# EasyEDA Pro project AstraPulse.epro

# Schematic 智能手环电路原理图
Board Name: 智能手环; Create Date: 2025-06-26; Page Name: 智能手环电路原理图P1; Project Name: 智能手环设计; Schematic Name: 智能手环电路原理图; Update Date: 2025-06-30; Company: 嘉立创EDA; Page Size: A3; Version: V1.0
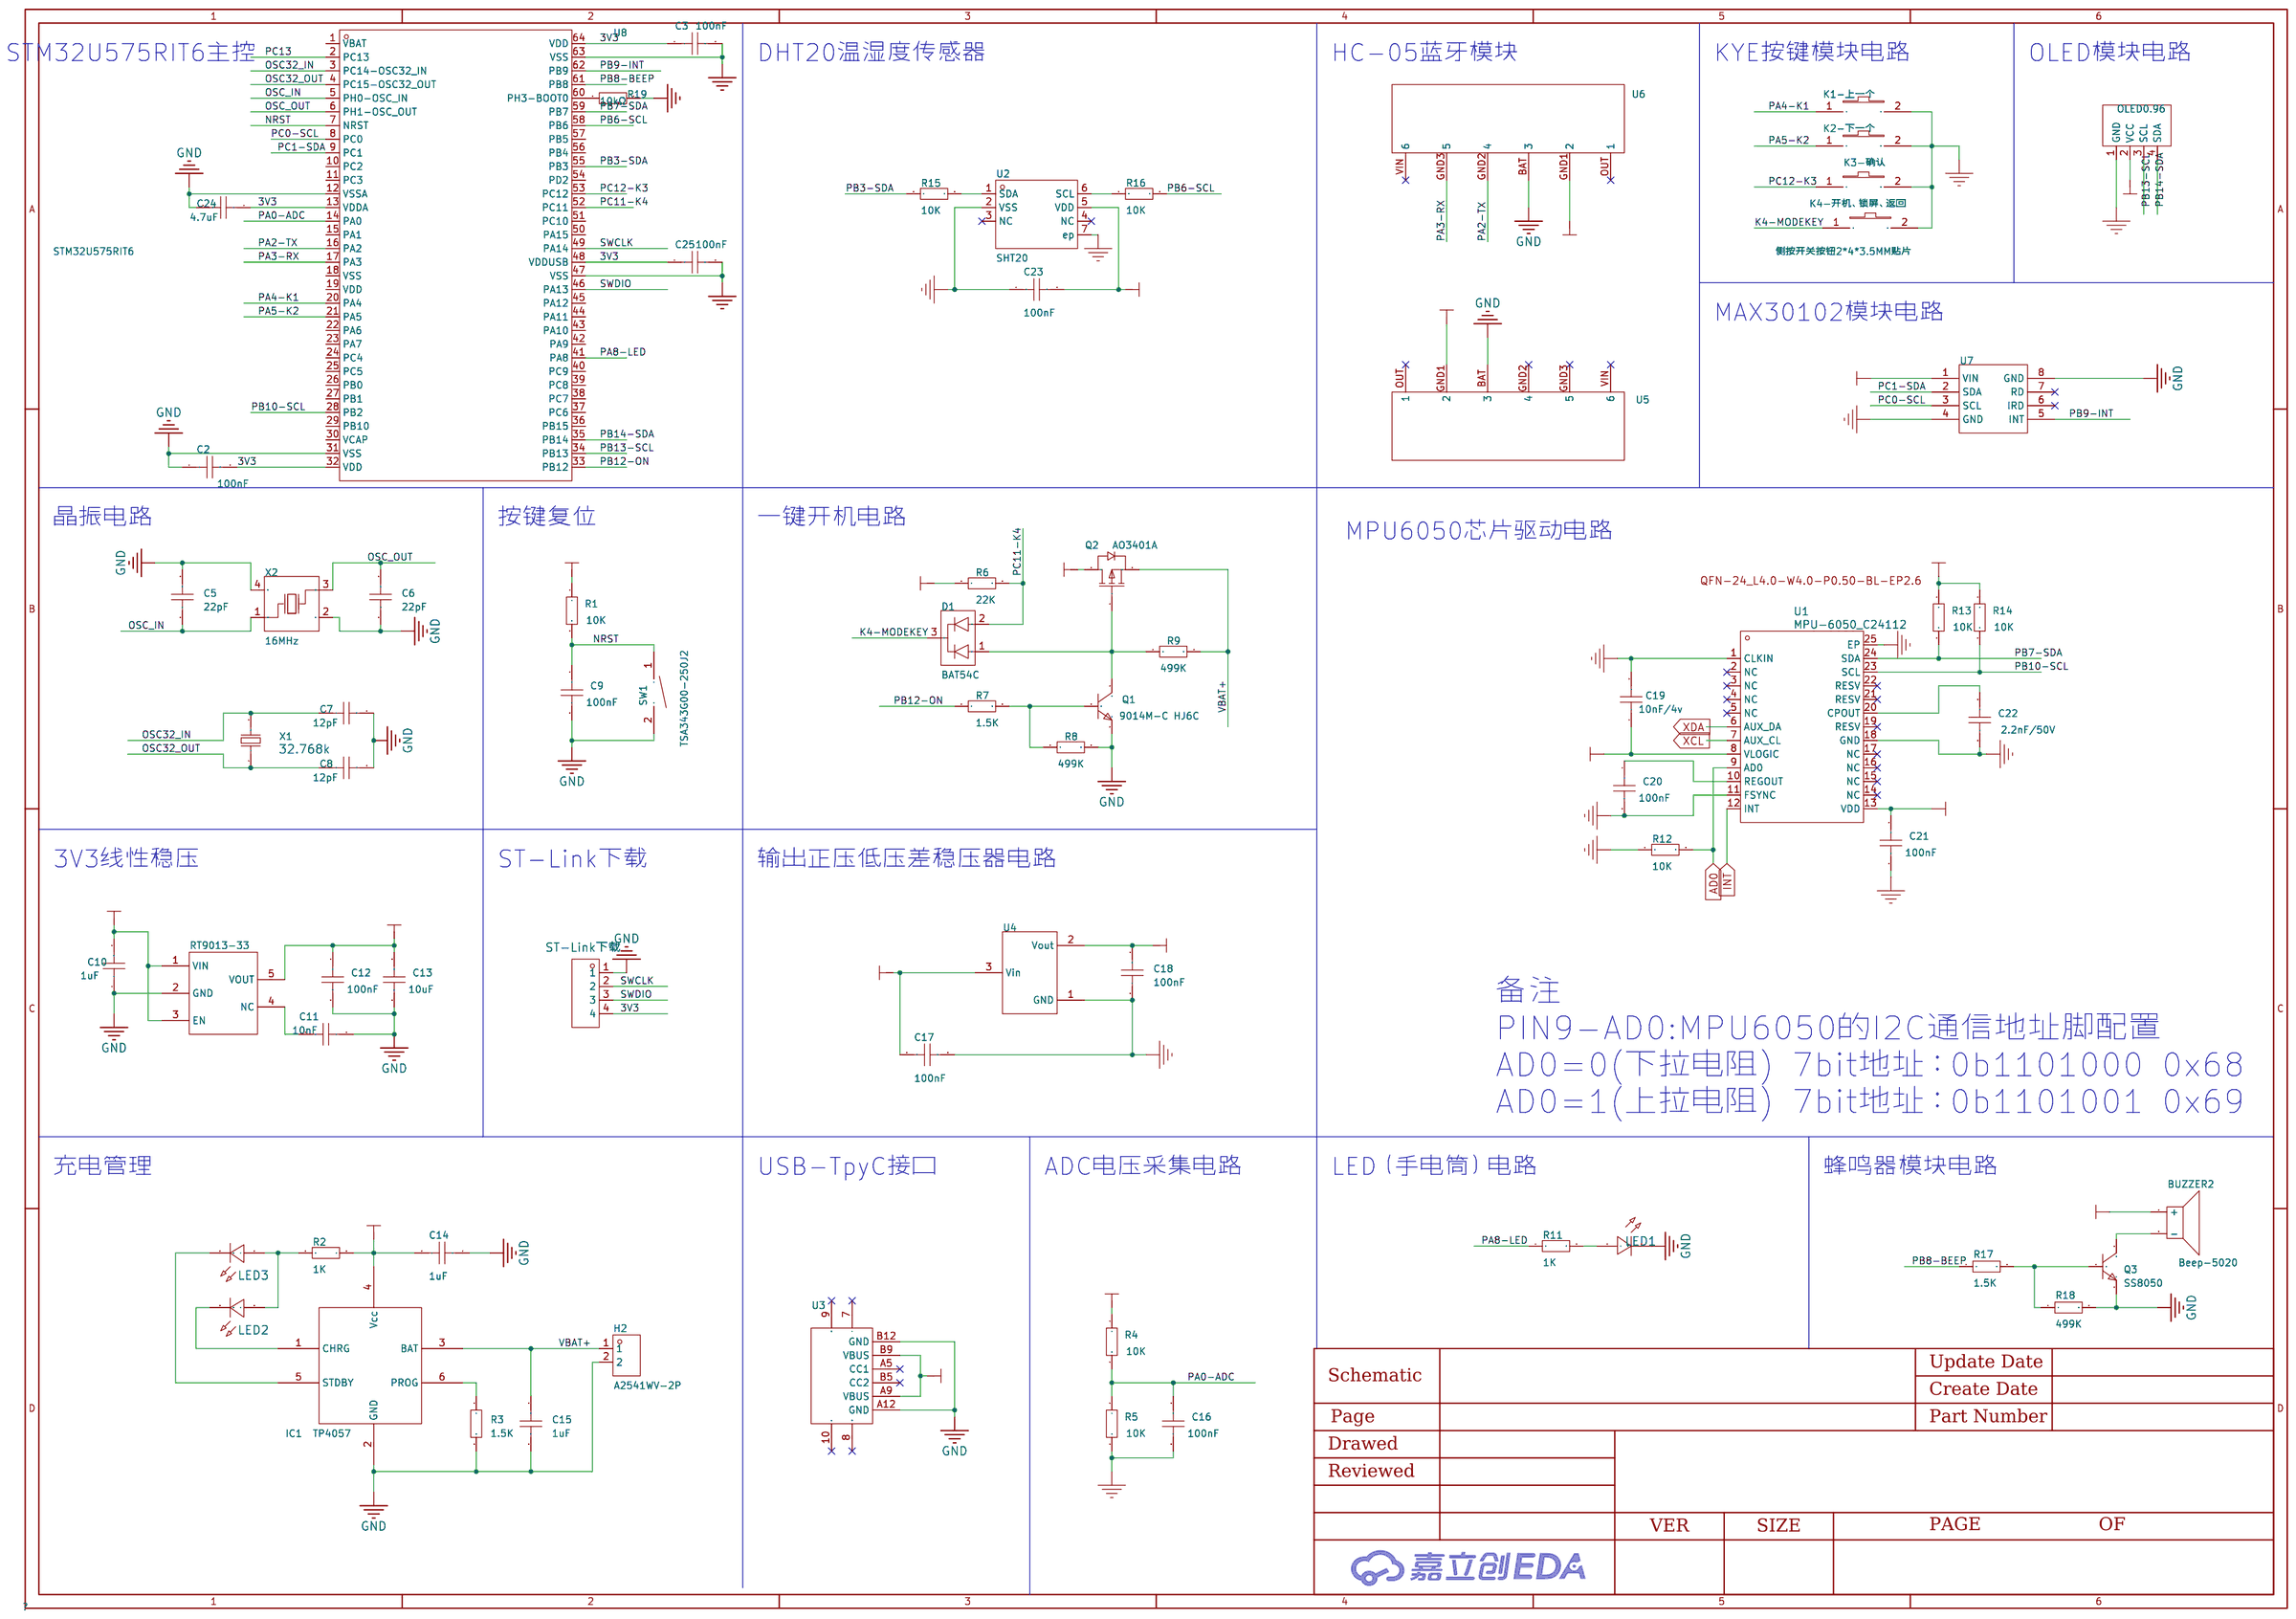
[diagram p0: schematic sheet]

## Parts
BUZZER2  Beep-5020  [5020BUZZER]
C2  100nF  [C0805]
C3  100nF  [C0805]
C5  22pF  [C0805]
C6  22pF  [C0805]
C7  12pF  [C0603]
C8  12pF  [C0603]
C9  100nF  [C0805]
C10  1uF  [C0603]
C11  10nF  [C0603]
C12  100nF  [C0805]
C13  10uF  [C0805]
C14  1uF  [C0603]
C15  1uF  [C0603]
C16  100nF  [C0805]
C17  100nF  [C0805]
C18  100nF  [C0805]
C19  100nF  [C0603]
C20  100nF  [C0805]
C21  100nF  [C0805]
C22  2.2nF/50V  [C0805]
C23  100nF  [C0805]
C24  4.7uF  [C0603]
C25  100nF  [C0805]
D1  BAT54C  [SOT-23-3_L2.9-W1.3-P1.90-LS2.4-BL-2]
H2  A2541WV-2P  [HDR-TH_P2.54-H-M_A2541WV-2P]
IC1  TP4057  [SOT23-6N]
K1-上一个  侧按开关按钮2*4*3.5MM贴片  [侧按开关按钮2*4*3.5MM贴片]
K2-下一个  侧按开关按钮2*4*3.5MM贴片  [侧按开关按钮2*4*3.5MM贴片]
K3-确认  侧按开关按钮2*4*3.5MM贴片  [侧按开关按钮2*4*3.5MM贴片]
K4-开机、锁屏、返回  侧按开关按钮2*4*3.5MM贴片  [侧按开关按钮2*4*3.5MM贴片]
LED1  -  [LED0805-RD_RED]
LED2  -  [LED0805-RD_RED]
LED3  -  [LED0805-RD_RED]
P1  OLED0.96  [0.96OLED_4P]
Q1  9014M-C HJ6C  [SOT-23-3_L2.9-W1.5-P1.90-LS2.6-BR]
Q2  AO3401A  [SOT-23_L2.9-W1.3-P1.90-LS2.4-BR]
Q3  SS8050  [SOT-23-3_L2.9-W1.3-P1.90-LS2.4-BR]
R1  10K  [R0805]
R2  1K  [R0805]
R3  1.5K  [R0603]
R4  10K  [R0805]
R5  10K  [R0805]
R6  22K  [R0603]
R7  1.5K  [R0603]
R8  499K  [R0603]
R9  499K  [R0603]
R11  1K  [R0805]
R12  10K  [R0805]
R13  10K  [R0805]
R14  10K  [R0805]
R15  10K  [R0805]
R16  10K  [R0805]
R17  1.5K  [R0603]
R18  499K  [R0603]
R19  10kΩ  [R0603]
RT9013-33  RT9013-33GB  [SOT-23-5_L3.0-W1.7-P0.95-LS2.8-BR]
ST-Link下载  ST-Link下载  [HDR-TH_4P-P2.54-V-M]
SW1  TSA343G00-250J2  [SW-SMD_L4.0-W2.9-LS5.0]
U1  MPU-6050_C24112  [QFN-24_L4.0-W4.0-P0.50-BL-EP2.6]
U2  SHT20  [DFN-6_L3.0-W3.0-P0.95-TR-EP]
U3  -  [Type C_SMD_6P]
U4  XC6206P332MR  [SOT-23-3_L2.9-W1.6-P1.90-LS2.8-BR]
U5  -  [5v六引脚焊盘]
U6  -  [5v六引脚焊盘]
U7  -  [MAX30102模块]
U8  STM32U575RIT6  [LQFP-64_L10.0-W10.0-P0.50-LS12.0-BL]
X1  32.768k  [CRYSTAL-SMD_L2.0-W1.2]
X2  16MHz  [OSC-SMD_4P-L3.2-W2.5-BL]

## Library data of the parts
BUZZER2 = Beep-5020
C2 C3 C5 C6 C9 C12 C13 C16-C18 C20-C23 C25 = CAP_0805: Supplier Footprint: 0805
C7 C8 C10 C11 C14 C15 C19 C24 = CAP_0603: 容值:100nF;精度:±10%;额定电压:50V;温度系数:X7R;; Supplier Footprint: 0603
D1 = BAT54C: 二极管配置:1对共阴极;直流反向耐压(Vr):30V;平均整流电流(Io):200mA;正向压降(Vf):520mV@100mA;反向电流(Ir):500A@25V;; LCSC Part Name: 30V 200mA 520mV@100mA; Supplier Part: C2688222; Manufacturer: WPMtek(维攀微); Supplier Footprint: SOT-23; JLCPCB Part Class: 扩展库; Datasheet: https://atta.szlcsc.com/upload/public/pdf/source/20210413/C2688222_4BA00EF72D68F115087B0C3F388C7378.pdf; Supplier: LCSC; Diode Configuration: 1对共阴极; Reverse Voltage (Vr): 30V; Average Rectified Current (Io): 200mA; Forward Voltage (Vf@If): 520mV@100mA; Reverse Leakage Current (Ir): 500A@25V
H2 = 焊盘: Supplier: LCSC; Supplier Part: C225477; Manufacturer: CJT(Changjiang Connectors); JLCPCB Part Class: 扩展库
IC1 = TP4057/4059
K1-上一个 K2-下一个 K3-确认 K4-开机、锁屏、返回 = 侧按开关按钮2*4*3.5MM贴片: link: https://item.taobao.com/item.htm?id=609087411286; 3DModel: SW-SMD_L7.6-W3.5-H3.5-P4.2; Supplier: LCSC; _: 3
LED1-LED3 = LED_0805-R: Supplier Footprint: 0805
P1 = OLED0.96
Q1 = 9014M-C HJ6C: 晶体管类型:NPN;集射极击穿电压(Vceo):45V;集电极电流(Ic):100mA;功率(Pd):400mW;集电极截止电流(Icbo):50nA;集电极-发射极饱和电压(VCE(sat)@Ic,Ib):140mV@100mA,5mA;直流电流增益(hFE@Ic,Vce):200@1mA,5V;特征频率(fT):270MHz;工作温度:+150℃@(Tj);; Supplier Part: C2859128; Manufacturer: BLUE ROCKET(蓝箭); Supplier Footprint: SOT-23; JLCPCB Part Class: 扩展库; Datasheet: https://atta.szlcsc.com/upload/public/pdf/source/20210806/E21B7633B099C6836F6A2D156763F1FF.pdf; Supplier: LCSC; Transistor Type: NPN; Collector-Emitter Breakdown Voltage (Vceo): 45V; Collector Current (Ic): 100mA; Power Dissipation (Pd): 400mW; Collector Cut-Off Current (Icbo): 50nA; Collector-Emitter Saturation Voltage (VCE(sat)@Ic,Ib): 140mV@100mA,5mA; DC Current Gain (hFE@Ic,Vce): 200@1mA,5V; Transition Frequency (fT): 270MHz; Operating Temperature: +150℃@(Tj)
Q2 = AO3401A_C15127: 类型:P沟道;漏源电压(Vdss):30V;连续漏极电流(Id):4A;功率(Pd):1.4W;导通电阻(RDS(on)@Vgs,Id):44mΩ@10V,4.3A;阈值电压(Vgs(th)@Id):1.3V@250A;; LCSC Part Name: P沟道 30V 4A; Supplier Part: C15127; Manufacturer: AOS; Supplier Footprint: SOT-23-3L; JLCPCB Part Class: 基础库; Datasheet: https://atta.szlcsc.com/upload/public/pdf/source/20160507/1462613609053.pdf; Supplier: LCSC; Type: P沟道; Drain Source Voltage (Vdss): 30V; Continuous Drain Current (Id): 4A; Power Dissipation (Pd): 1.4W; Drain Source On Resistance (RDS(on)@Vgs,Id): 44mΩ@10V,4.3A; Gate Threshold Voltage (Vgs(th)@Id): 1.3V@250A
Q3 = SS8050: Supplier Part: C2984679; Manufacturer: 集晶电子; Supplier Footprint: SOT-23; Datasheet: https://atta.szlcsc.com/upload/public/pdf/source/20220324/C9C5DC8A4D94A268D9E3BE9A0C1D5819.pdf; Supplier: LCSC
R1 R2 R4 R5 R11-R16 = Res_0805: Supplier Footprint: 0805
R3 R6-R9 R17 R18 = Res_0603: Supplier Footprint: 0603
R19 = 0603WAF1002T5E: 电阻类型:厚膜电阻;阻值:10kΩ;精度:±1%;功率:100mW;最大工作电压:75V;温度系数:±100ppm/℃;; LCSC Part Name: 厚膜电阻 10kΩ ±1% 100mW; Supplier Part: C25804; Manufacturer: UNI-ROYAL(厚声); Supplier Footprint: 0603; JLCPCB Part Class: 基础库; Datasheet: https://atta.szlcsc.com/upload/public/pdf/source/20200306/C422600_1E6D84923E4A46A82E41ADD87F860B5C.pdf; Supplier: LCSC; Type: 厚膜电阻; Tolerance: ±1%; Power(Watts): 100mW; Overload Voltage (Max): 75V; Temperature Coefficient: ±100ppm/℃; Operating Temperature Range: -55℃~+155℃
RT9013-33 = RT9013-33GB: 输出类型:固定;输出极性:正;输出通道数:1;最大输入电压:5.5V;输出电压:3.3V;压差:400mV@(500mA);静态电流(地电流):-;输出电流:500mA;电源纹波抑制比(PRSS):50dB@(10kHz);噪声:-;特性:-;; LCSC Part Name: Vin=5.5V Vout=3.3V 500mA 50dB@(10kHz); Supplier Part: C47773; Manufacturer: RICHTEK(台湾立锜); Supplier Footprint: SOT-23-5; Datasheet: https://atta.szlcsc.com/upload/public/pdf/source/20150504/1457707282459.pdf; Supplier: LCSC; Output Type: 固定; Output Polarity: 正; Number of Outputs: 1; Maximum Input Voltage: 5.5V; Output Voltage: 3.3V; Dropout Voltage: 400mV@(500mA); Output Current: 500mA; Power Supply Rejection Ratio (PRSS): 50dB@(10kHz)
ST-Link下载 = HDR-M_2.54_1x4P: Supplier Part: C492403; Supplier Footprint: 插件
SW1 = TSA343G00-250J2: 触点电流:50mA;额定电压(DC):12V;绝缘电阻:100MΩ;电路结构:单刀单掷;安装方式:立贴;按钮形状:圆形按钮;按钮/盖帽颜色:黑色;带灯:无;作用力:250gf@±50gf;机械寿命:50000;工作温度:-25℃~+70℃;引脚样式:SMD接片;开关长度:3.95mm;开关宽度:2.9mm;开关高度:2mm;带支架:否;; LCSC Part Name: 3*4 两脚小龟不带柱  250gf; Supplier Part: C354946; Manufacturer: BRIGHT(博瑞泰); Supplier Footprint: SMD; JLCPCB Part Class: 扩展库; Datasheet: https://atta.szlcsc.com/upload/public/pdf/source/20190426/C354946_6B70DFBDFA823D17B8EB46FB9599F693.pdf; Supplier: LCSC; Contact Current: 50mA; Voltage Rating (DC): 12V; Insulation Resistance: 100MΩ; Circuit: 单刀单掷; Mounting Style: 立贴; Actuator Style: 圆形按钮; Actuator/Cap Color: 黑色; With Lamp: 无; Operating Force: 250gf@±50gf; Mechanical Life: 50000; Operating Temperature: -25℃~+70℃; Pin Style: SMD接片; Switch Length: 3.95mm; Switch Width: 2.9mm; Switch Height: 2mm; Strike Gundam: 否
U1 = MPU-6050_C24112: Supplier: LCSC; Manufacturer: InvenSense; Manufacturer Part: MPU-6050; image: //image.lceda.cn/szlcsc/C24112.jpg; Supplier Part: C24112; JLCPCB Part Class: Basic
U2 = SHT20: 传感器类型:Humidity, Temperature;输出类型:I²C;温度范围:-;湿度范围:0 ~ 100% RH;精度:±3% RH;; Supplier Part: C53865; Manufacturer: Sensirion(瑞士盛思锐); Supplier Footprint: DFN-6; JLCPCB Part Class: 扩展库; Datasheet: https://atta.szlcsc.com/upload/public/pdf/source/20151012/1457707445424.pdf; Supplier: LCSC; Sensor Type: Humidity, Temperature; Output Type: I²C; Humidity Range: 0 ~ 100% RH; Response Time: 8s; Accuracy: ±3% RH; Voltage-Supply: 2.1 V ~ 3.6 V; Operating Temperature: -40°C ~ 125°C
U3 = USB
U4 = XC6206P332MR_C5446: 输出类型:固定;输出极性:正;输出通道数:1;最大输入电压:6V;输出电压:3.3V;压差:680mV@(100mA);输出电流:200mA;电源纹波抑制比(PRSS):-;; LCSC Part Name: Vin=6V Vout=3.3V 200mA; Supplier Part: C5446; Manufacturer: TOREX(特瑞仕); Supplier Footprint: SOT-23-3L; JLCPCB Part Class: 基础库; Datasheet: https://atta.szlcsc.com/upload/public/pdf/source/20130801/1457706628791.pdf; Supplier: LCSC; Output Type: 固定; Output Polarity: 正; Number of Outputs: 1; Maximum Input Voltage: 6V; Output Voltage: 3.3V; Dropout Voltage: 680mV@(100mA); Output Current: 200mA
U5 U6 = 焊盘
U7 = MAX30102模块: Pin Type: IN
U8 = STM32U575RIT6: 超低功耗，采用带 Trust Zone 的 FPU Arm Cortex-M33、具有 1Mbytes 闪存的 160 MHz MCU; LCSC Part Name: 超低功耗带 FPU 的 Arm Cortex-M33 具有 Trust Zone，160 MHz MCU 带 2MB 闪存; Supplier Part: C5270993; Manufacturer: ST(意法半导体); Supplier Footprint: LQFP-64(10x10); JLCPCB Part Class: 扩展库; Supplier: LCSC
X1 = NX2012SA-32.768KHZ-EXS00A-MU00185: LCSC Part Name: 晶振; Supplier Part: C5136772; Manufacturer: NDK; Supplier Footprint: SMD2012-2P; Datasheet: https://atta.szlcsc.com/upload/public/pdf/source/20220817/FD1986C2337CA9746430CB47DBD29D81.pdf; Supplier: LCSC
X2 = X322516MLB4SI: 晶振类型:贴片晶振;频率:16MHz;常温频差:±10ppm;负载电容:9pF;频率稳定度:±20ppm;; LCSC Part Name: YSX321SL 16MHZ 4P 3225 9PF ±10PPM -40~85℃ (±20PPM); Supplier Part: C13738; Manufacturer: YXC(扬兴晶振); Supplier Footprint: SMD3225-4P; JLCPCB Part Class: 基础库; Datasheet: https://atta.szlcsc.com/upload/public/pdf/source/20240329/19D5F850207469550BEB00D7DFEDBC7A.pdf; Supplier: LCSC; Type: 贴片晶振; Normal temperature Frequency Tolerance: ±10ppm; Load Capacitance: 9pF; Frequency Stability: ±20ppm; Operating Temperature: -40℃~+85℃

## Nets
3V3: BUZZER2.1(+) C2.2 C3.1 C12.1 C13.1 C18.1 C19.1 C23.2 C24.1 C25.1 P1.2(VCC) R1.1 R13.1 R14.1 RT9013-33.5(VOUT) ST-Link下载.4 U1.8(VLOGIC) U2.5(VDD) U4.2(Vout) U5.GND1(2) U6.GND1(2) U7.1(VIN) U8.13(VDDA) U8.32(VDD) U8.48(VDDUSB) U8.64(VDD)
5V: C10.2 C14.2 IC1.4(Vcc) R2.2 RT9013-33.1(VIN) RT9013-33.3(EN) U3.A9(VBUS) U3.B9(VBUS)
+3V3: C21.1 U1.13(VDD)
GND: C2.1 C3.2 C5.1 C6.2 C7.2 C8.2 C9.2 C10.1 C11.2 C12.2 C13.2 C14.1 C15.2 C16.2 C17.2 C18.2 C19.2 C20.2 C21.2 C22.2 C23.1 C24.2 C25.2 H2.2 IC1.2(GND) K1-上一个.2 K2-下一个.2 K3-确认.2 K4-开机、锁屏、返回.2 LED1.1(C) P1.1(GND) Q1.2(E) Q3.2(E) R3.2 R5.2 R8.2 R12.1 R18.2 R19.1 RT9013-33.2(GND) ST-Link下载.1 SW1.2 U1.1(CLKIN) U1.11(FSYNC) U1.18(GND) U1.25(EP) U2.2(VSS) U2.7(ep) U3.A12(GND) U3.B12(GND) U4.1(GND) U5.BAT(3) U6.BAT(3) U7.4(GND) U7.8(GND) U8.12(VSSA) U8.31(VSS) U8.47(VSS) U8.63(VSS) X2.2(GND) X2.4(GND)
VBAT+: C15.1 H2.1 IC1.3(BAT) Q2.2(S) R9.2
AD0: R12.2 U1.9(AD0)
INT: U1.12(INT)
K4-MODEKEY: D1.3 K4-开机、锁屏、返回.1
NRST: C9.1 R1.2 SW1.1 U8.7(NRST)
OSC32_IN: C7.1 U8.3(PC14-OSC32_IN) X1.2
OSC32_OUT: C8.1 U8.4(PC15-OSC32_OUT) X1.1
OSC_IN: C5.2 U8.5(PH0-OSC_IN) X2.1(OSC1)
OSC_OUT: C6.1 U8.6(PH1-OSC_OUT) X2.3(OSC2)
PA0-ADC: C16.1 R4.2 R5.1 U8.14(PA0)
PA2-TX: U6.GND2(4) U8.16(PA2)
PA3-RX: U6.GND3(5) U8.17(PA3)
PA4-K1: K1-上一个.1 U8.20(PA4)
PA5-K2: K2-下一个.1 U8.21(PA5)
PA8-LED: R11.1 U8.41(PA8)
PB3-SDA: R15.1 U8.55(PB3)
PB6-SCL: R16.2 U8.58(PB6)
PB7-SDA: R13.2 U1.24(SDA) U8.59(PB7)
PB8-BEEP: R17.1 U8.61(PB8)
PB9-INT: U7.5(INT) U8.62(PB9)
PB10-SCL: R14.2 U1.23(SCL) U8.28(PB2)
PB12-ON: R7.1 U8.33(PB12)
PB13-SCL: P1.3(SCL) U8.34(PB13)
PB14-SDA: P1.4(SDA) U8.35(PB14)
PC0-SCL: U7.3(SCL) U8.8(PC0)
PC1-SDA: U7.2(SDA) U8.9(PC1)
PC11-K4: D1.2 R6.2 U8.52(PC11)
PC12-K3: K3-确认.1 U8.53(PC12)
PC13: U8.2(PC13)
SWCLK: ST-Link下载.2 U8.49(PA14)
SWDIO: ST-Link下载.3 U8.46(PA13)
VBIN: C17.1 Q2.3(D) R4.1 R6.1 U4.3(Vin)
XCL: U1.7(AUX_CL)
XDA: U1.6(AUX_DA)
$1N2261: C11.1 RT9013-33.4(NC)
$1N12198: C20.1 U1.10(REGOUT)
$1N12210: C22.1 U1.20(CPOUT)
$1N23815: LED1.2(A) R11.2
$1N30743: R15.2 U2.1(SDA)
$1N30780: R16.1 U2.6(SCL)
$1N48772: LED2.2(A) LED3.2(A) R2.1
$1N48899: IC1.1(CHRG) LED2.1(C)
$1N48944: IC1.5(STDBY) LED3.1(C)
$1N49675: IC1.6(PROG) R3.1
$1N61002: D1.1 Q1.3(C) Q2.1(G) R9.1
$1N62160: Q1.1(B) R7.2 R8.1
$1N117138: Q3.1(B) R17.2 R18.1
$1N117609: BUZZER2.2(-) Q3.3(C)
$1N136520: R19.2 U8.60(PH3-BOOT0)

Not connected (* = marked no-connect by the designer): U1 2(NC)* 3(NC)* 4(NC)* 5(NC)* 14(NC)* 15(NC)* 16(NC)* 17(NC)* 19(RESV)* 21(RESV)* 22(RESV)*; U2 3(NC)* 4(NC)*; U3 7* 8(10)* 9(8)* 10(9)* A5(CC1)* B5(CC2)*; U5 GND2(4)* GND3(5)* OUT(1)* VIN(6)*; U6 OUT(1)* VIN(6)*; U7 6(IRD)* 7(RD)*; U8 1(VBAT) 10(PC2) 11(PC3) 15(PA1) 18(VSS) 19(VDD) 22(PA6) 23(PA7) 24(PC4) 25(PC5) 26(PB0) 27(PB1) 29(PB10) 30(VCAP) 36(PB15) 37(PC6) 38(PC7) 39(PC8) 40(PC9) 42(PA9) 43(PA10) 44(PA11) 45(PA12) 50(PA15) 51(PC10) 54(PD2) 56(PB4) 57(PB5)

## Notes on the sheet
- STM32U575RIT6主控
- DHT20温湿度传感器
- HC-05蓝牙模块
- KYE按键模块电路
- OLED模块电路
- MAX30102模块电路
- 晶振电路
- 按键复位
- 一键开机电路
- MPU6050芯片驱动电路
- 3V3线性稳压
- ST-Link下载
- 输出正压低压差稳压器电路
- 备注
  PIN9-AD0:MPU6050的I2C通信地址脚配置
  AD0=0(下拉电阻) 7bit地址：0b1101000 0x68
  AD0=1(上拉电阻) 7bit地址：0b1101001 0x69
- 充电管理
- USB-TpyC接口
- ADC电压采集电路
- LED（手电筒）电路
- 蜂鸣器模块电路

# Board 智能手环PCB1
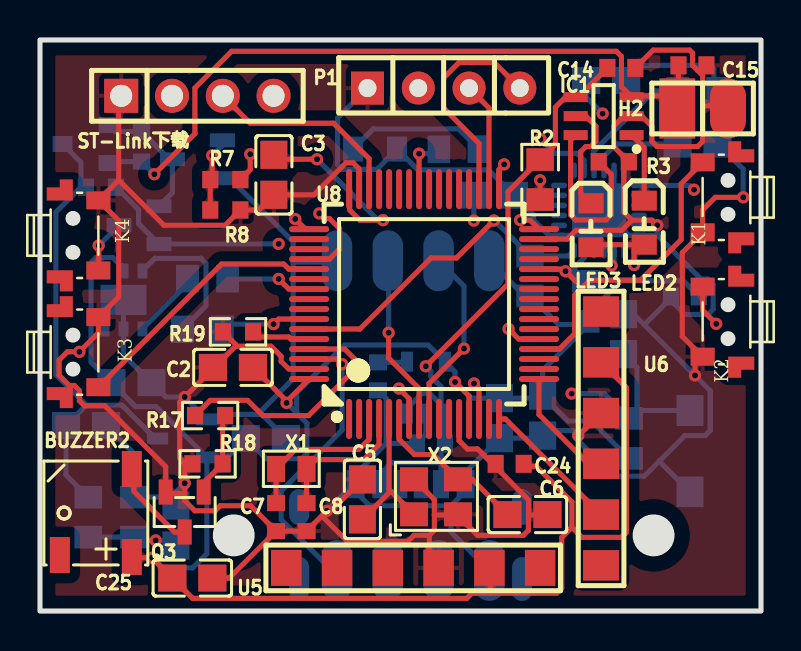
[diagram p1: board, top side]
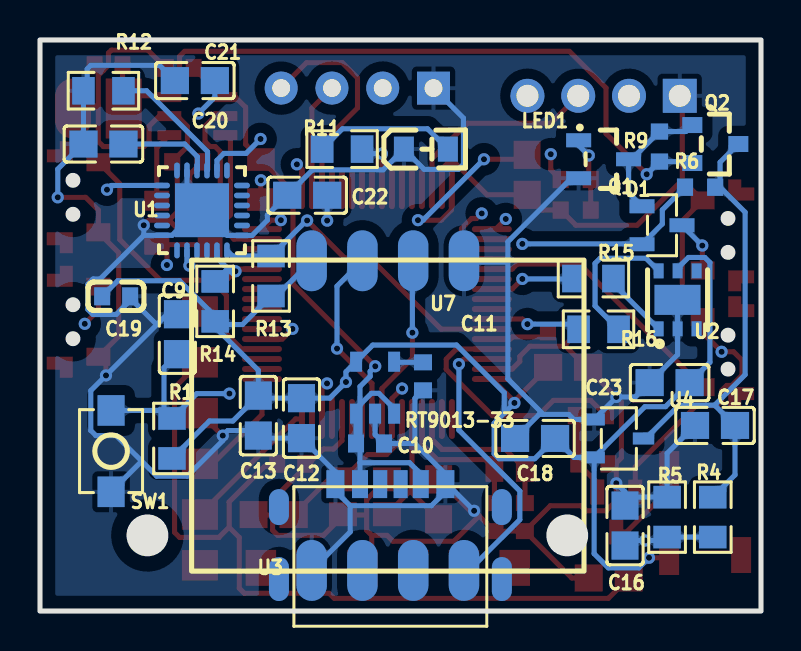
[diagram p2: board, bottom side, seen from below]

Outline 36.07 x 28.58 mm; copper layers: Top Layer, VCC, GND, Bottom Layer. Coordinates in mm from the lower left corner of the outline.
Outline path: rectangle 0,28.58 36.07,0
Stack: Top Layer 0.035mm / Dielectric1 0.48mm PP er 4.5 / VCC 0.035mm / Dielectric2 0.48mm FR4 er 4.5 / GND 0.035mm / Dielectric3 0.48mm PP er 4.5 / Bottom Layer 0.035mm

## Design rules (mm)
spacing safeClearance (default): track to track 0.152, other pairs 0.152 to 0.3
track width trackWidth (default): min 0.127, default 0.254, max 2.54
differential pair differentialPair (default): width min 0.127, default 0.254, max 2.54; gap min 0.152, default 0.152
via viaSize (default): diameter min 0.5, default 0.61, max 10; hole min 0.3, default 0.305, max 6
net GND uses copperRegion1

## Placement (name value [footprint] x y rotation side)
BUZZER2  Beep-5020  [5020BUZZER]  2.79 4.95 0 top
C2  100nF  [C0805]  9.65 12.19 0 top
C3  100nF  [C0805]  11.7 21.83 270 top
C5  22pF  [C0805]  16.13 5.59 270 top
C6  22pF  [C0805]  24.38 4.83 0 top
C7  12pF  [C0603]  11.81 4.7 270 top
C8  12pF  [C0603]  13.34 4.7 270 top
C9  100nF  [C0805]  29.19 13.85 90 bottom
C10  1uF  [C0603]  19.56 8.38 0 bottom
C11  10nF  [C0603]  16.91 11.74 270 bottom
C12  100nF  [C0805]  22.99 9.65 270 bottom
C13  10uF  [C0805]  25.15 9.78 270 bottom
C14  1uF  [C0603]  29.08 27.18 180 top
C15  1uF  [C0603]  32.64 27.3 0 top
C16  100nF  [C0805]  6.8 4.28 90 bottom
C17  100nF  [C0805]  2.3 9.29 0 bottom
C18  100nF  [C0805]  11.3 8.64 0 bottom
C19  100nF  [C0603]  32.26 15.75 180 bottom
C20  100nF  [C0805]  32.89 23.37 0 bottom
C21  100nF  [C0805]  28.32 26.54 0 bottom
C22  2.2nF/50V  [C0805]  22.7 20.81 0 bottom
C23  100nF  [C0805]  4.57 11.43 180 bottom
C24  4.7uF  [C0603]  23.5 7.37 180 top
C25  100nF  [C0805]  7.62 1.65 0 top
D1  BAT54C  [SOT-23-3_L2.9-W1.3-P1.90-LS2.4-BL-2]  4.95 19.3 270 bottom
H2  A2541WV-2P  [HDR-TH_P2.54-H-M_A2541WV-2P]  33.15 25.15 0 top
IC1  TP4057  [SOT23-6N]  28.19 24.77 90 top
K1  -  [侧按开关按钮2*4*3.5MM贴片]  34.42 20.7 270 top
K2  -  [侧按开关按钮2*4*3.5MM贴片]  34.42 14.48 270 top
K3  -  [侧按开关按钮2*4*3.5MM贴片]  1.65 12.95 90 top
K4  -  [侧按开关按钮2*4*3.5MM贴片]  1.65 18.8 90 top
LED1  -  [LED0805-RD_RED]  16.76 23.11 180 bottom
LED2  -  [LED0805-RD_RED]  30.23 19.43 270 top
LED3  -  [LED0805-RD_RED]  27.56 19.3 270 top
P1  OLED0.96  [0.96OLED_4P]  20.19 27.69 0 top
Q1  9014M-C HJ6C  [SOT-23-3_L2.9-W1.5-P1.90-LS2.6-BR]  7.87 22.61 0 bottom
Q2  AO3401A  [SOT-23_L2.9-W1.3-P1.90-LS2.4-BR]  2.29 23.37 0 bottom
Q3  SS8050  [SOT-23-3_L2.9-W1.3-P1.90-LS2.4-BR]  7.24 4.95 90 top
R1  10K  [R0805]  29.46 8.64 90 bottom
R2  1K  [R0805]  25.02 21.59 90 top
R3  1.5K  [R0603]  28.7 22.48 0 top
R4  10K  [R0805]  2.41 4.7 270 bottom
R5  10K  [R0805]  4.7 4.7 90 bottom
R6  22K  [R0603]  3.05 21.21 0 bottom
R7  1.5K  [R0603]  9.27 21.59 180 top
R8  499K  [R0603]  9.27 20.07 0 top
R9  499K  [R0603]  5.08 23.24 270 bottom
R11  1K  [R0805]  20.96 23.11 0 bottom
R12  10K  [R0805]  32.89 26.03 180 bottom
R13  10K  [R0805]  24.51 16.76 90 bottom
R14  10K  [R0805]  27.31 15.49 90 bottom
R15  10K  [R0805]  8.38 16.64 180 bottom
R16  10K  [R0805]  8.13 14.1 0 bottom
R17  1.5K  [R0603]  8.51 9.78 0 top
R18  499K  [R0603]  8.38 7.37 180 top
R19  10kΩ  [R0603]  9.91 13.97 0 top
RT9013-33  RT9013-33GB  [SOT-23-5_L3.0-W1.7-P0.95-LS2.8-BR]  19.3 11.18 270 bottom
ST-Link下载  ST-Link下载  [HDR-TH_4P-P2.54-V-M]  7.87 25.78 0 top
SW1  TSA343G00-250J2  [SW-SMD_L4.0-W2.9-LS5.0]  32.51 8 270 bottom
U1  MPU-6050_C24112  [QFN-24_L4.0-W4.0-P0.50-BL-EP2.6]  27.96 20.04 90 bottom
U2  SHT20  [DFN-6_L3.0-W3.0-P0.95-TR-EP]  4.17 15.57 0 bottom
U3  -  [Type C_SMD_6P]  21.34 6.35 180 bottom
U4  XC6206P332MR  [SOT-23-3_L2.9-W1.6-P1.90-LS2.8-BR]  7.11 8.64 0 bottom
U5  -  [5v六引脚焊盘]  9.91 2.67 180 top
U6  -  [5v六引脚焊盘]  27.56 -0.13 270 top
U7  -  [MAX30102模块]  18.67 9.78 90 bottom
U8  STM32U575RIT6  [LQFP-64_L10.0-W10.0-P0.50-LS12.0-BL]  19.21 15.36 0 top
X1  32.768k  [CRYSTAL-SMD_L2.0-W1.2]  12.57 7.11 180 top
X2  16MHz  [OSC-SMD_4P-L3.2-W2.5-BL]  19.81 5.72 0 top

## Footprints (pads in the part's own frame, mm; a bottom-side part is the same pattern mirrored in y, then rotated)
0.96OLED_4P
  rect 1.65x1.65 hole 0.89: 1(-3.81,-1.52)
  round 1.65 hole 0.89: 2(-1.27,-1.518) 3(1.27,-1.518) 4(3.81,-1.518)
5v六引脚焊盘
  rect 1.524x1.8 smd: EN(-15.113,0.508) GND(-10.033,0.508) RXD(-4.953,0.508) STATE(-2.413,0.508) TXD(-7.493,0.508) VCC(-12.573,0.508)
5020BUZZER
  custom 1x1.8 smd: 1(1.8,-2.25) 2(1.8,2.152) 3(-1.8,-2.151)
C0603
  rect 0.8x0.9 smd: 1(-0.7,0) 2(0.7,0)
C0805
  rect 1.41x1.35 smd: 1(-1,0) 2(1,0)
CRYSTAL-SMD_L2.0-W1.2
  rect 0.899x1.3 smd: 1(-0.762,0) 2(0.762,0)
DFN-6_L3.0-W3.0-P0.95-TR-EP
  rect 0.5x0.75 smd: 1(0.95,1.453) 2(0,1.45) 3(-0.95,1.45) 4(-0.95,-1.45) 5(0,-1.453) 6(0.95,-1.45)
  rect 2.301x1.501 smd: 7(0.005,0)
HDR-TH_4P-P2.54-V-M
  rect 1.7x1.7 hole 1.1: 1(-3.81,0)
  round 1.7 hole 1.1: 2(-1.27,0) 3(1.27,0) 4(3.81,0)
HDR-TH_P2.54-H-M_A2541WV-2P
  rect 1.8x3 smd: 1(-1.27,0)
  oval 1.8x3 smd: 2(1.27,0)
LED0805-RD_RED
  rect 1x1.25 smd: 1(-1.1,0) 2(1.1,0)
LQFP-64_L10.0-W10.0-P0.50-LS12.0-BL
  oval 0.3x2 smd: 1(-3.75,-5.75) 2(-3.25,-5.75) 3(-2.75,-5.75) 4(-2.25,-5.75) 5(-1.75,-5.75) 6(-1.25,-5.75) 7(-0.75,-5.75) 8(-0.25,-5.75) 9(0.25,-5.75) 10(0.75,-5.75) 11(1.25,-5.75) 12(1.75,-5.75) 13(2.25,-5.75) 14(2.75,-5.75) 15(3.25,-5.75) 16(3.75,-5.75) 33(3.75,5.75) 34(3.25,5.75) 35(2.75,5.75) 36(2.25,5.75) 37(1.75,5.75) 38(1.25,5.75) 39(0.75,5.75) 40(0.25,5.75) 41(-0.25,5.75) 42(-0.75,5.75) 43(-1.25,5.75) 44(-1.75,5.75) 45(-2.25,5.75) 46(-2.75,5.75) 47(-3.25,5.75) 48(-3.75,5.75)
  oval 2x0.3 smd: 17(5.75,-3.75) 18(5.75,-3.25) 19(5.75,-2.75) 20(5.75,-2.25) 21(5.75,-1.75) 22(5.75,-1.25) 23(5.75,-0.75) 24(5.75,-0.25) 25(5.75,0.25) 26(5.75,0.75) 27(5.75,1.25) 28(5.75,1.75) 29(5.75,2.25) 30(5.75,2.75) 31(5.75,3.25) 32(5.75,3.75) 49(-5.75,3.75) 50(-5.75,3.25) 51(-5.75,2.75) 52(-5.75,2.25) 53(-5.75,1.75) 54(-5.75,1.25) 55(-5.75,0.75) 56(-5.75,0.25) 57(-5.75,-0.25) 58(-5.75,-0.75) 59(-5.75,-1.25) 60(-5.75,-1.75) 61(-5.75,-2.25) 62(-5.75,-2.75) 63(-5.75,-3.25) 64(-5.75,-3.75)
MAX30102模块
  oval 3.048x1.524 smd: 1(7.747,3.81) 2(7.747,1.27) 3(7.747,-1.27) 4(7.747,-3.81) 5(-7.747,-3.81) 6(-7.747,-1.27) 7(-7.747,1.27) 8(-7.747,3.81)
OSC-SMD_4P-L3.2-W2.5-BL
  rect 1.4x1.2 smd: 1(-1.1,-0.875) 2(1.1,-0.875) 3(1.1,0.875) 4(-1.1,0.875)
QFN-24_L4.0-W4.0-P0.50-BL-EP2.6
  oval 0.28x0.8 smd: 1(-1.25,-2) 2(-0.75,-2) 3(-0.25,-2) 4(0.25,-2) 5(0.75,-2) 6(1.25,-2) 13(1.25,2) 14(0.75,2) 15(0.25,2) 16(-0.25,2) 17(-0.75,2) 18(-1.242,2)
  oval 0.8x0.28 smd: 7(2,-1.25) 8(2,-0.75) 9(2,-0.25) 10(2,0.25) 11(2,0.75) 12(2,1.25) 19(-2,1.25) 20(-2,0.75) 21(-2,0.25) 22(-2,-0.25) 23(-2,-0.75) 24(-2,-1.25)
  rect 2.7x2.7 smd: 25(0.013,0)
R0603
  rect 0.806x0.864 smd: 1(-0.753,0) 2(0.753,0)
R0805
  rect 1.133x1.377 smd: 1(-1,0) 2(1,0)
SOT23-6N
  rect 0.5x1.2 smd: 1(-0.95,-1.4) 2(0,-1.4) 3(0.95,-1.4) 4(0.95,1.4) 5(0,1.4) 6(-0.95,1.4)
SOT-23-3_L2.9-W1.3-P1.90-LS2.4-BL-2
  rect 0.7x1.25 smd: 1(-0.95,-1) 2(0.95,-1) 3(0,1)
SOT-23-3_L2.9-W1.3-P1.90-LS2.4-BR
  rect 1.25x0.7 smd: 1(1,-0.95) 2(1,0.95) 3(-1,0)
SOT-23-3_L2.9-W1.5-P1.90-LS2.6-BR
  rect 1.25x0.7 smd: 1(1.25,-0.95) 2(1.25,0.95) 3(-1.25,0)
SOT-23-3_L2.9-W1.6-P1.90-LS2.8-BR
  rect 1.07x0.6 smd: 1(1.235,-0.95) 2(1.235,0.95) 3(-1.235,0)
SOT-23-5_L3.0-W1.7-P0.95-LS2.8-BR
  rect 1x0.6 smd: 1(1.3,-0.95) 2(1.3,0) 3(1.3,0.95) 4(-1.3,0.95) 5(-1.3,-0.95)
SOT-23_L2.9-W1.3-P1.90-LS2.4-BR
  rect 1x0.8 smd: 1(1.15,-0.95) 2(1.15,0.95) 3(-1.15,0)
SW-SMD_L4.0-W2.9-LS5.0
  rect 1.53x1.36 smd: 1(-2.035,0) 2(2.035,0)
Type C_SMD_6P
  oval 1x1.8 smd: 7(-2.779,-1.15) 8(8.371,-1.15)
  oval 1x2.2 smd: 9(-2.779,-4.75) 10(8.371,-4.75)
  rect 0.7x1.4 smd: A5(2.286,0) B5(3.306,0)
  rect 0.8x1.4 smd: A9(4.316,0) B9(1.276,0)
  rect 0.9x1.4 smd: A12(5.546,0) B12(0.046,0)
侧按开关按钮2*4*3.5MM贴片
  rect 0.9x1.2 smd: 1(-1.753,-1.27) 2(1.753,-1.27)
  custom 1.05x1.3 smd: 3(-2.2,0.66) 4(2.2,0.66)

## Nets
As in the schematic, except:
3V3: BUZZER2.1 C2.2 C3.1 C12.1 C13.1 C18.1 C19.1 C23.2 C24.1 C25.1 P1.2 R1.1 R13.1 R14.1 RT9013-33.5 ST-Link下载.4 U1.8 U2.5 U4.2 U5.VCC U6.VCC U7.1 U8.13 U8.32 U8.48 U8.64
GND: C2.1 C3.2 C5.1 C6.2 C7.2 C8.2 C9.2 C10.1 C11.2 C12.2 C13.2 C14.1 C15.2 C16.2 C17.2 C18.2 C19.2 C20.2 C21.2 C22.2 C23.1 C24.2 C25.2 H2.2 IC1.2 K1.2 K2.2 K3.2 K4.2 LED1.1 P1.1 Q1.2 Q3.2 R3.2 R5.2 R8.2 R12.1 R18.2 R19.1 RT9013-33.2 ST-Link下载.1 SW1.2 U1.1 U1.11 U1.18 U1.25 U2.2 U2.7 U3.A12 U3.B12 U4.1 U5.GND U6.GND U7.4 U7.8 U8.12 U8.31 U8.47 U8.63 X2.2 X2.4
K4-MODEKEY: D1.3 K4.1
PA2-TX: U6.RXD U8.16
PA3-RX: U6.TXD U8.17
PA4-K1: K1.1 U8.20
PA5-K2: K2.1 U8.21
PB4-K3: K3.1 U8.53
PB5-K4: D1.2 R6.2 U8.52

Pads without a net: BUZZER2 3; K1 3 4; K2 3 4; K3 3 4; K4 3 4; U1 2 3 4 5 14 15 16 17 19 21 22; U2 3 4; U3 7 8 9 10 A5 B5; U5 EN RXD STATE TXD; U6 EN STATE; U7 6 7; U8 1 10 11 15 18 19 22 23 24 25 26 27 29 30 36 37 38 39 40 42 43 44 45 50 51 54 56 57

## Via types
v1: diameter 0.61, hole 0.305, Top Layer to Bottom Layer, 44 vias

## Routing (per net, layer and track width the routed paths; a pad name or vN(x,y) marks a point on that pad's centre or on a via; arc(x,y) is an arc through that point)
3V3: length 169.2
  Top Layer w0.254: v1(17.16,19.56) 16,19.56 15.49,20.07 15.49,21.08 U8.48 ; C24.1 24.32,7.24 24.83,7.24 26.61,5.46 26.61,4.19 ; 26.61,4.19 27.12,3.68 29.08,3.68 29.34,3.94 29.34,11.18 U6.VCC ; 26.61,4.19 26.1,3.68 26.1,1.14 25.85,0.89 22.54,0.89 ; v1(13.86,22.61) 11.92,22.61 C3.1 ; v1(12.34,10.41) 12.34,10.48 ; 12.34,10.48 13.46,11.61 ; 12.34,10.48 12.34,10.51 C2.2 ; 22.54,0.89 22.54,2.09 22.48,2.16 ; 22.54,0.89 21.61,0.89 21.35,0.63 7.64,0.63 C25.1 v1(5.6,2.67) 4.63,2.67 BUZZER2.1 ; v1(24.02,19.56) 24.51,19.56 U8.32 ; U8.13 21.46,10.76 v1(20.76,11.46)
  VCC w0.254: 23.26,20.07 23.26,20.83 25.29,22.86 25.29,23.37 v1(25.03,23.62) ; 23.26,20.07 23.51,20.07 v1(24.02,19.56) ; 23.26,20.07 23,20.07 22.75,20.32 21.48,20.32 20.85,19.69 20.85,19.19 19.19,17.53 ; v1(12.34,10.41) 12.34,10.67 19.19,17.53 ; 19.19,17.53 v1(17.16,19.56) ; ST-Link下载.4 13.86,23.61 v1(13.86,22.61) 15.36,22.61 P1.2
  Bottom Layer w0.254: 27.18,14.33 25.94,14.33 R13.1 24.24,15.76 U7.1 ; 27.18,14.33 R14.1 27.31,14.75 29.08,16.53 32.18,16.53 C19.1 ; 27.18,14.33 27.18,14.08 25.15,12.05 C13.1 ; v1(5.6,2.67) 6.11,2.16 7.64,2.16 8.35,2.87 U4.2 ; v1(13.86,22.61) 16.91,19.56 v1(17.16,19.56) ; v1(25.03,23.62) 25.76,22.9 26.87,22.9 27.21,22.55 U1.8 ; 12.84,9.91 13.35,9.4 13.35,7.87 13.1,7.62 11.32,7.62 C18.1 9.35,7.69 U4.2 ; 12.84,9.91 v1(12.34,10.41) ; 12.84,9.91 12.84,10.92 15.23,13.31 19.42,13.31 RT9013-33.5 20.76,11.97 v1(20.76,11.46) 21.57,10.65 C12.1 25.02,10.65 C13.1 ; U4.2 5.81,10.23 4.78,10.23 C23.2 2.56,12.45 2.56,17.44 2.81,17.69 3.63,17.69 4.17,17.15 U2.5 ; C13.1 26.42,9.51 27.59,9.51 R1.1
5V: length 33.9
  Top Layer w0.254: C14.2 26.92,25.72 IC1.4 26.29,25.72 25.78,25.21 25.78,23.35 R2.2 23.41,20.98 23.41,16.36 v1(19.3,12.25)
  Bottom Layer w0.254: 20.06,8.18 20.06,7.42 ; 20.06,8.18 C10.2 20.26,9.87 ; 20.06,8.18 20.06,10.32 ; 20.06,7.42 U3.B9 ; 20.06,7.42 17.58,7.42 17.08,6.91 17.08,6.41 U3.A9 ; RT9013-33.3 18.35,10.13 19.12,10.89 19.49,10.89 20.06,10.32 ; 20.06,10.32 20.06,11.23 19.55,11.74 19.55,11.99 v1(19.3,12.25) ; 20.06,10.32 20.25,10.13 RT9013-33.1
+3V3: length 11
  VCC w0.254: v1(32.72,21.08) 28.91,24.89 v1(28.14,24.89)
  Bottom Layer w0.254: U1.13 32.5,21.29 v1(32.72,21.08) ; v1(28.14,24.89) 27.32,25.72 C21.1
GND: length 269.1
  Top Layer w0.254: 3.94,21.56 3.94,25.65 ST-Link下载.1 ; 3.94,21.56 K4.2 3.94,19.53 3.94,15.72 K3.2 2.92,13.92 v1(1.97,12.97) 1.37,12.97 0.96,12.56 0.96,11.8 1.46,11.29 1.72,11.29 1.97,11.03 1.97,10.52 2.22,10.27 3.24,10.27 6.29,7.22 Q3.2 6.36,5.89 7.24,5.89 ; 3.94,21.56 6.2,19.3 9.26,19.3 R8.2 10.94,20.07 C3.2 13.7,20.83 15.3,22.43 15.66,22.43 15.96,22.13 15.96,21.11 ; 22.65,7.34 24.43,5.57 24.43,4.8 ; 22.65,7.34 21.89,8.11 21.38,8.11 20.96,8.53 20.96,9.61 ; 22.65,7.34 22.77,7.34 C24.2 ; 7.24,5.89 7.24,5.52 7.75,5.02 8.76,5.02 9.02,5.27 10.54,5.27 C7.2 ; 7.24,5.89 v1(7.24,6.39) 7.24,7.41 ; 29.61,19.56 29.2,19.96 29.2,22.22 R3.2 28.69,23.24 28.69,24.26 29.2,24.77 IC1.2 30.1,24.77 30.61,24.26 30.61,23.5 30.86,23.24 32.9,23.24 33.15,23.5 33.15,25.27 ; 29.61,19.56 29.1,19.05 26.81,19.05 26.37,18.61 U8.31 ; 29.61,19.56 30.62,19.56 v1(30.88,19.3) ; 19.47,3.79 19.47,2.62 19.94,2.16 ; 19.47,3.79 19.73,4.04 19.73,4.8 ; 19.47,3.79 18.71,3.79 18.41,3.49 15.37,3.49 14.1,4.76 ; R18.2 7.59,7.41 7.24,7.41 ; C5.1 14.56,5.02 v1(14.35,5.02) 14.1,4.76 ; 14.1,4.76 C8.2 C7.2 ; U6.GND 26.94,8.78 v1(26.92,8.78) ; 8.76,12.24 9.78,13.25 ; 8.76,12.24 v1(7.24,10.71) 6.99,10.46 6.99,7.66 7.24,7.41 ; 8.76,12.24 8.7,12.24 C2.1 ; 9.78,13.25 11.56,13.25 12.06,12.74 12.06,12.49 12.44,12.11 13.46,12.11 ; 9.78,13.25 9.78,13.34 R19.1 ; C7.2 9.46,1.65 C25.2 ; v1(32.77,11.79) 32.77,12.34 K2.2 32.13,13.74 32.13,17.93 K1.2 33.15,20.07 33.78,20.7 v1(35.18,20.7) ; 24.43,4.8 24.43,4.04 24.18,3.79 21.89,3.79 20.88,4.8 ; 24.43,4.8 25.36,4.8 C6.2 ; 33.15,25.27 34.29,25.27 H2.2 ; 33.15,25.27 33.15,26.8 32.9,27.05 ; 19.73,4.8 20.88,4.8 ; 19.73,4.8 19.73,5.57 X2.4 ; 20.88,4.8 X2.2 ; C14.1 30.67,28.07 32.5,28.07 32.64,27.92 32.64,27.3 32.9,27.05 ; 32.9,27.05 33.09,27.05 C15.2
  Bottom Layer w0.254: 20.55,5.27 20.55,3.96 U7.8 ; 20.55,5.27 16.49,5.27 15.72,6.03 15.72,6.28 ; 20.55,5.27 21.29,6.01 U3.B12 21.29,6.95 C12.2 25.02,8.65 C13.2 25.4,9.03 26.67,9.03 v1(26.92,8.78) 26.92,8.52 28.7,6.75 30.23,6.75 30.99,7.51 ; SW1.2 30.99,7.49 30.99,7.51 ; v1(7.24,6.39) 6.8,5.96 6.8,5.7 ; C9.2 29.7,14.85 30.23,14.33 ; 4.17,15.57 U2.2 4.17,12.83 C23.1 6.29,10.71 v1(7.24,10.71) 7.24,10.69 U4.1 9.36,9.59 9.62,9.84 10.89,9.84 ; 12.66,17.46 14.79,17.46 U7.4 ; 12.66,17.46 12.66,18.48 9.49,21.66 Q1.2 ; 12.66,17.46 12.66,11.62 10.89,9.84 ; 6.8,5.7 C16.2 ; 6.8,5.7 4.7,5.7 ; C21.2 30.08,27.3 33.53,27.3 33.71,27.13 33.71,26.22 R12.1 C20.2 33.92,23.37 35.18,22.11 v1(35.18,20.7) ; 31.5,15.6 32.26,14.84 33.42,14.84 33.67,15.09 33.67,16.36 33.42,16.62 33.06,16.62 30.88,18.8 ; 31.5,15.6 31.5,15.69 C19.2 ; 31.5,15.6 30.23,14.33 ; 17.31,8.38 17.31,10.64 C11.2 ; 17.31,8.38 C10.1 19.3,8.83 RT9013-33.2 ; 17.31,8.38 15.79,6.86 U3.A12 15.72,6.28 ; U1.11 28.71,20.6 28.19,20.07 ; U1.18 29.46,18.8 28.19,20.07 ; 30.88,18.8 v1(30.88,19.3) ; 30.88,18.8 29.97,18.8 ; 30.23,14.33 v1(32.77,11.79) 33.53,11.03 33.53,9.03 33.27,8.78 32.26,8.78 30.99,7.51 ; 15.72,6.28 15.62,6.28 v1(14.35,5.02) ; 10.89,9.84 11.1,9.84 C18.2 ; 28.19,20.07 U1.25 26.7,18.79 U1.1 25.46,18.79 24.69,19.56 24.69,19.81 C22.2 22.43,22.08 18.9,22.08 LED1.1 16.85,22.1 15.14,22.1 14.88,22.35 14.88,24.67 P1.1 ; C17.2 4.7,7.89 R5.2
VBAT+: length 36.7
  Top Layer w0.254: 29.59,25.72 IC1.3 ; 29.59,25.72 29.65,25.78 31.94,25.78 ; 29.59,25.72 29.09,26.23 29.09,27.75 28.83,28.01 9.58,28.01 7.75,26.17 7.75,23.89 v1(5.72,21.86) ; 31.94,27.3 31.94,25.78 ; 31.94,25.78 31.94,25.21 31.88,25.15
  Bottom Layer w0.254: v1(5.72,21.86) R9.2 3.51,22.49 Q2.2
AD0: length 6.4
  Bottom Layer w0.254: R12.2 30.73,26.03 27.69,22.99 27.69,22.07 U1.9
K4-MODEKEY: length 2.7
  Top Layer w0.254: K4.1 2.94,17.06 v1(2.94,18.29)
  Bottom Layer w0.254: D1.3 v1(2.94,18.29)
NRST: length 21
  Top Layer w0.254: v1(17.96,11.13) 18.46,10.63 U8.7
  VCC w0.254: v1(26.59,10.88) 25.32,12.15 20.5,12.15 19.48,11.13 v1(17.96,11.13)
  Bottom Layer w0.254: v1(26.59,10.88) 28.22,10.88 R1.2 29.86,10.04 ; C9.1 29.86,12.18 29.86,10.04 ; 29.86,10.04 SW1.1
OSC32_IN: length 8
  Top Layer w0.254: U8.3 16.46,8.59 15.96,8.09 12.78,8.09 X1.2 C7.1
OSC32_OUT: length 7.1
  Top Layer w0.254: 16.96,9.61 16.96,8.34 16.2,7.58 13.8,7.58 X1.1 C8.1
OSC_IN: length 7.3
  Top Layer w0.254: C5.2 17.46,5.92 17.46,6.09 ; 17.46,6.09 X2.1 ; 17.46,6.09 U8.5
OSC_OUT: length 8
  Top Layer w0.254: 17.96,9.61 17.96,8.59 18.73,7.83 19.67,7.83 X2.3 21.62,6.59 C6.1
PA0-ADC: length 25.6
  Top Layer w0.254: v1(21.71,11.39) 21.96,11.13 21.96,9.61
  VCC w0.254: v1(21.71,11.39) 16.12,5.8 8.06,5.8 v1(5.79,3.53)
  Bottom Layer w0.254: R4.2 R5.1 4.87,3.53 v1(5.79,3.53) 6.55,3.53 C16.1
PA2-TX: length 7.1
  Top Layer w0.254: 22.96,9.61 23.28,9.61 U6.RXD
PA3-RX: length 5.9
  Top Layer w0.254: U8.17 24.96,9.83 27.43,7.37 U6.TXD
PA4-K1: length 14.8
  Top Layer w0.254: K1.1 32.08,21.38 32.08,18.59 30.04,16.56 27.5,16.56 26.74,15.79 26.74,13.87 25.98,13.11 U8.20
PA5-K2: length 14.4
  Top Layer w0.254: K2.1 33.15,15.05 v1(33.83,14.37) ; U8.21 23.95,13.61 v1(23.44,14.12)
  VCC w0.254: v1(23.44,14.12) 33.57,14.12 v1(33.83,14.37)
PA8-LED: length 2.9
  Top Layer w0.254: 18.96,21.11 v1(18.96,22.89)
  Bottom Layer w0.254: R11.1 19.73,22.89 v1(18.96,22.89)
PB3-SDA: length 4.3
  Top Layer w0.254: v1(11.94,16.62) 12.45,16.11 13.46,16.11
  Bottom Layer w0.254: R15.1 9.4,16.62 v1(11.94,16.62)
PB4-K3: length 13.2
  Top Layer w0.254: 13.46,17.11 12.45,17.11 12.19,17.36 9.08,17.36 K3.1
PB5-K4: length 16.5
  Top Layer w0.254: v1(13.97,19.9) 14.23,19.64 14.48,19.64 14.99,19.13 14.99,18.12 14.48,17.61 13.46,17.61
  VCC w0.254: v1(13.97,19.9) 12.45,18.37 v1(11.94,18.37)
  Bottom Layer w0.254: v1(11.94,18.37) 5.97,18.37 D1.2 4.94,19.37 4.94,20.07 R6.2
PB6-SCL: length 4.5
  Top Layer w0.254: v1(11.69,14.36) 11.94,14.61 13.46,14.61
  Bottom Layer w0.254: v1(11.69,14.36) 9.39,14.36 R16.2
PB7-SDA: length 16.4
  Top Layer w0.254: 13.46,14.11 16,14.11 19.56,17.67 20.83,17.67 v1(22.71,19.54)
  Bottom Layer w0.254: U1.24 26.43,17.76 R13.2 22.73,19.54 v1(22.71,19.54)
PB8-BEEP: length 12.6
  Top Layer w0.254: R17.1 8.52,10.54 10.39,10.54 11.15,9.78 13.43,9.78 15.75,12.09 15.75,12.6 15.24,13.11 13.46,13.11
PB9-INT: length 14.6
  Top Layer w0.254: v1(15.11,12.36) 14.86,12.61 13.46,12.61
  Bottom Layer w0.254: v1(15.11,12.36) 15.11,9.05 12.06,6.01 12.06,4.57 14.6,2.03 U7.5
PB10-SCL: length 4.6
  Top Layer w0.254: 26.8,16.49 26.18,17.11 U8.28
  Bottom Layer w0.254: U1.23 27.21,17.67 26.54,17 ; v1(26.29,17) 26.54,17 ; 26.54,17 26.8,17 R14.2
PB12-ON: length 16.4
  Top Layer w0.254: R7.1 10.52,22.08 v1(10.52,22.86) ; 22.96,21.11 22.96,22.1 v1(23.22,22.35)
  VCC w0.254: v1(23.22,22.35) 22.46,21.59 11.79,21.59 v1(10.52,22.86)
PB13-SCL: length 5.5
  Top Layer w0.254: U8.34 22.46,25.17 21.46,26.17
PB14-SDA: length 11
  Top Layer w0.254: P1.4 22.73,27.44 20.95,27.44 20.19,26.68 20.19,25.17 21.96,23.4 21.96,21.11
PC0-SCL: length 8.6
  Top Layer w0.254: 18.96,9.61 18.96,11.13 17.44,12.66 v1(17.44,13.93)
  Bottom Layer w0.254: v1(17.44,13.93) 17.44,17.49 U7.3
PC1-SDA: length 9.2
  Top Layer w0.254: U8.9 19.46,11.39 v1(21.21,13.13)
  Bottom Layer w0.254: 19.94,17.53 21.21,16.26 v1(21.21,13.13)
SWCLK: length 9.6
  Top Layer w0.254: 13.46,19.11 13.28,19.11 v1(12.77,19.62)
  VCC w0.254: v1(12.77,19.62) ST-Link下载.2
SWDIO: length 10.1
  Top Layer w0.254: ST-Link下载.3 10.51,24.41 14.69,24.41 16.46,22.63 U8.46
VBIN: length 24.6
  Bottom Layer w0.254: 2.05,21.21 R6.1 ; 2.05,21.21 0.79,19.95 0.79,11.83 2.32,10.3 ; 2.05,21.21 2.05,22.46 Q2.3 ; 2.32,10.3 C17.1 1.3,6.81 R4.1 ; 2.32,10.3 4.1,10.3 5.76,8.64 5.88,8.64
$1N2261: length 1.5
  Bottom Layer w0.254: RT9013-33.4 18.32,12.44 C11.1
$1N12198: length 4.7
  Bottom Layer w0.254: U1.10 28.19,22.06 28.19,22.73 28.83,23.37 C20.1
$1N12210: length 9.9
  VCC w0.254: v1(28.59,17.28) 27.86,18.01 23.23,18.01 v1(21.7,19.54)
  Bottom Layer w0.254: v1(28.59,17.28) 28.71,17.4 U1.20 ; C22.1 v1(21.7,19.54)
$1N23815: length 7.1
  Bottom Layer w0.254: LED1.2 16.68,24.13 20.94,24.13 R11.2
$1N30743: length 3.5
  Bottom Layer w0.254: R15.2 7.38,16.38 U2.1
$1N30780: length 7.3
  Bottom Layer w0.254: R16.1 8.3,15.27 8.3,17.4 8.05,17.65 5.76,17.65 U2.6
$1N48772: length 11.2
  Top Layer w0.254: LED2.2 29.72,18.33 ; 29.72,18.33 v1(29.72,17.31) ; 29.72,18.33 27.69,18.33 LED3.2 ; v1(25.02,21.55) R2.1
  VCC w0.254: v1(25.02,21.55) 25.48,21.55 v1(29.72,17.31)
$1N48899: length 3.5
  Top Layer w0.254: LED2.1 30.23,23.18 IC1.1
$1N48944: length 5.8
  Top Layer w0.254: IC1.5 27.3,24.77 27.81,24.26 27.81,23.5 27.56,23.24 27.3,23.24 27.05,22.99 27.05,20.91 LED3.1
$1N49675: length 9.3
  Top Layer w0.254: IC1.6 26.54,23.56 26.54,19.82 26.79,19.57 28.32,19.57 28.57,19.82 28.57,21.86 R3.1
$1N61002: length 6.5
  Bottom Layer w0.254: D1.1 6.62,20.93 Q1.3 6.47,22.61 R9.1 3.76,23.99 Q2.1
$1N62160: length 3.7
  Top Layer w0.254: v1(8.62,22.79) 8.62,21.69 R7.2 R8.1
  Bottom Layer w0.254: v1(8.62,22.79) 9.12,23.3 Q1.1
$1N117138: length 4.3
  Top Layer w0.254: R17.2 9.14,9.65 R18.1 8.19,6.42 Q3.1
$1N117609: length 4.5
  Top Layer w0.254: BUZZER2.2 4.7,7 4.7,5.98 6.73,3.95 Q3.3
$1N136520: length 3
  Top Layer w0.254: R19.2 10.91,13.72 12.44,13.72 12.54,13.61 13.46,13.61

## Copper pours and planes (outline as drawn; the poured copper is in the pictures)
GND on Top Layer: -0.76,28.96 36.45,28.96 36.45,-0.51 -0.76,-0.51
GND on Bottom Layer: -1.11,28.96 36.83,28.96 36.83,-0.38 -1.11,-0.38

Small or netless copper shapes (teardrops, artwork), in the pictures only: 179 on Top Layer, 174 on Bottom Layer, 28 on VCC
